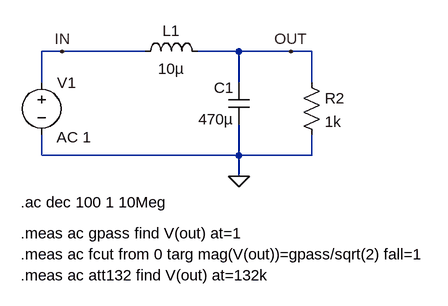
[diagram p0: schematic SMPS_Noisefilter.asc]
SMPS_Noisefilter.asc, the LTspice schematic file:
Version 4.1
SHEET 1 880 680
WIRE -144 80 -176 80
WIRE -16 80 -144 80
WIRE 128 80 64 80
WIRE 208 80 128 80
WIRE 240 80 208 80
WIRE -176 128 -176 80
WIRE 128 128 128 80
WIRE 240 128 240 80
WIRE -176 240 -176 208
WIRE 128 240 128 192
WIRE 128 240 -176 240
WIRE 240 240 240 208
WIRE 240 240 128 240
WIRE 128 272 128 240
FLAG 128 272 0
FLAG -144 80 IN
FLAG 208 80 OUT
SYMBOL cap 144 128 M0
SYMATTR InstName C1
SYMATTR Value 470µ
SYMBOL ind -32 96 R270
WINDOW 0 32 56 VTop 2
WINDOW 3 5 56 VBottom 2
SYMATTR InstName L1
SYMATTR Value 10µ
SYMBOL voltage -176 112 R0
WINDOW 123 23 100 Left 2
WINDOW 39 0 0 Left 0
SYMATTR InstName V1
SYMATTR Value ""
SYMATTR Value2 AC 1
SYMBOL res 224 112 R0
SYMATTR InstName R2
SYMATTR Value 1k
TEXT -208 312 Left 2 !.ac dec 100 1 10Meg
TEXT -208 424 Left 2 !.meas ac att132 find V(out) at=132k
TEXT -208 392 Left 2 !.meas ac fcut from 0 targ mag(V(out))=gpass/sqrt(2) fall=1
TEXT -208 360 Left 2 !.meas ac gpass find V(out) at=1

The netlist it stands for:
* SMPS_Noisefilter.asc
C1 OUT 0 470µ
L1 IN OUT 10µ
V1 IN 0 AC 1
R2 OUT 0 1k
.ac dec 100 1 10Meg
.meas ac att132 find V(out) at=132k
.meas ac fcut from 0 targ mag(V(out))=gpass/sqrt(2) fall=1
.meas ac gpass find V(out) at=1
.backanno
.end